# Altium schematic sheet IDC_Tester_v1_sift_register_output.SchDoc
size 420 x 297 mm; SheetNumber: 2; SheetTotal: 10
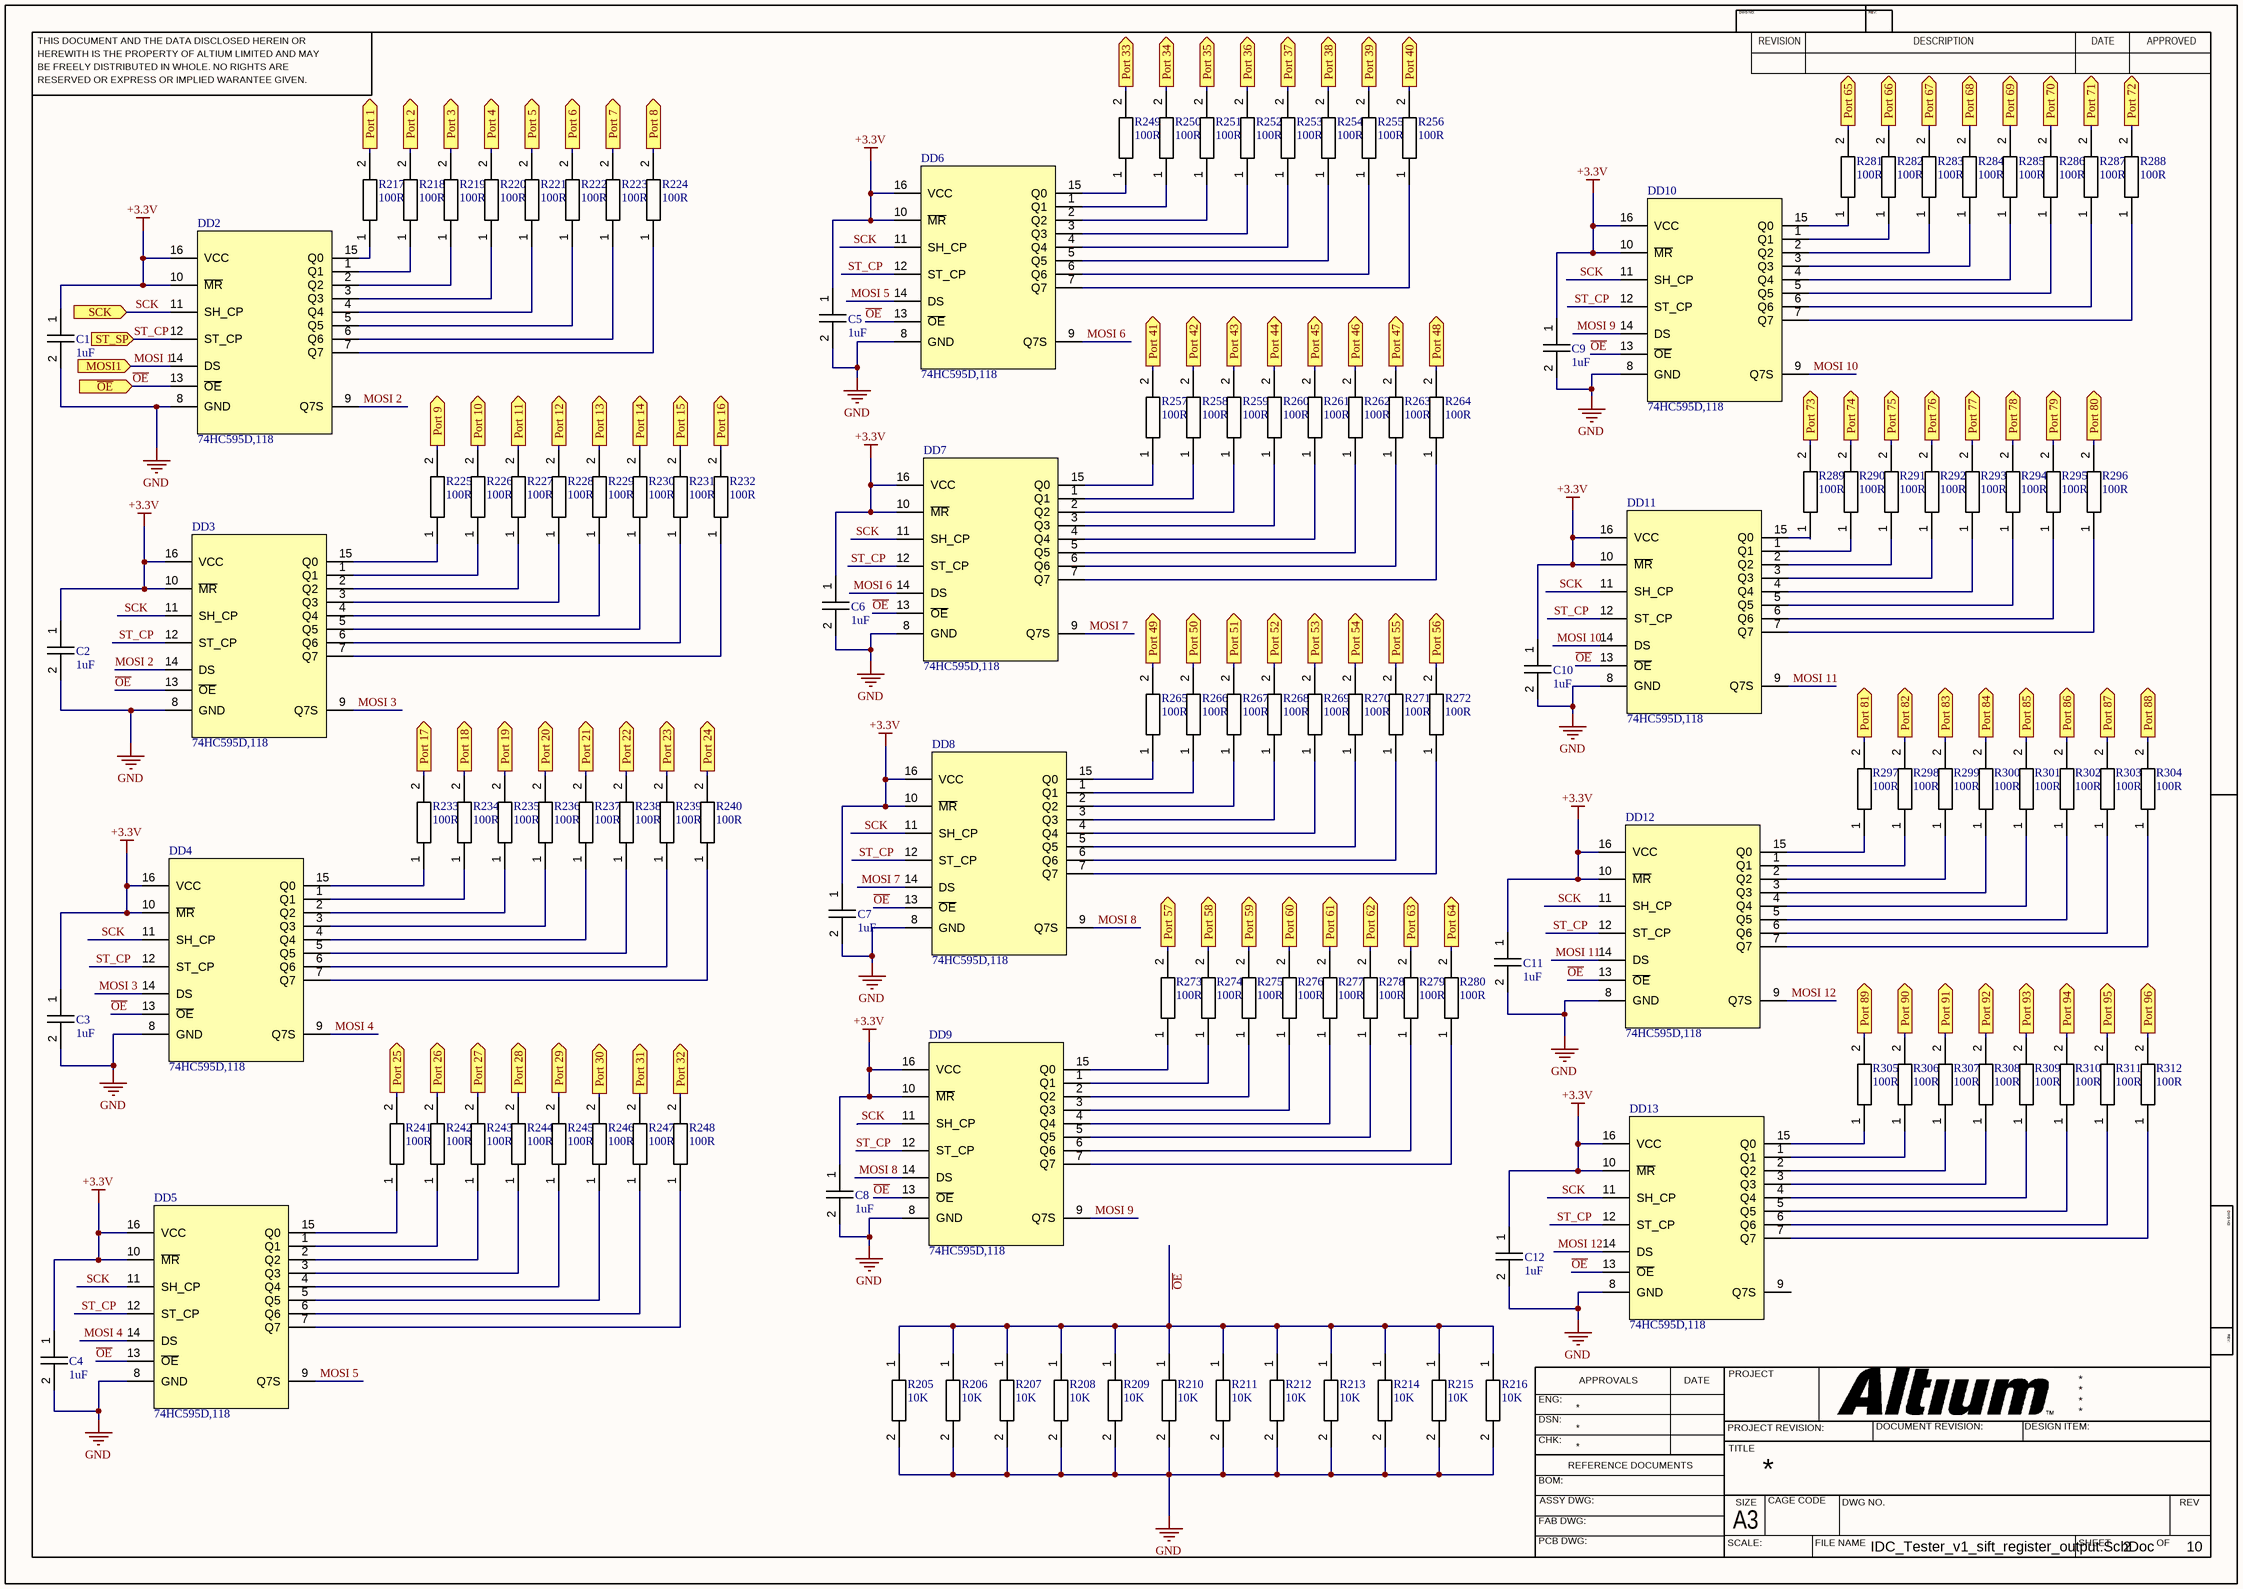
[diagram p0: IDC_Tester_v1_sift_register_output.SchDoc]

## Parts
C1  1uF  [Capacitor 0603]
C2  1uF  [Capacitor 0603]
C3  1uF  [Capacitor 0603]
C4  1uF  [Capacitor 0603]
C5  1uF  [Capacitor 0603]
C6  1uF  [Capacitor 0603]
C7  1uF  [Capacitor 0603]
C8  1uF  [Capacitor 0603]
C9  1uF  [Capacitor 0603]
C10  1uF  [Capacitor 0603]
C11  1uF  [Capacitor 0603]
C12  1uF  [Capacitor 0603]
DD2  74HC595D,118  [Shift register 74HC165 or 74HC595]
DD3  74HC595D,118  [Shift register 74HC165 or 74HC595]
DD4  74HC595D,118  [Shift register 74HC165 or 74HC595]
DD5  74HC595D,118  [Shift register 74HC165 or 74HC595]
DD6  74HC595D,118  [Shift register 74HC165 or 74HC595]
DD7  74HC595D,118  [Shift register 74HC165 or 74HC595]
DD8  74HC595D,118  [Shift register 74HC165 or 74HC595]
DD9  74HC595D,118  [Shift register 74HC165 or 74HC595]
DD10  74HC595D,118  [Shift register 74HC165 or 74HC595]
DD11  74HC595D,118  [Shift register 74HC165 or 74HC595]
DD12  74HC595D,118  [Shift register 74HC165 or 74HC595]
DD13  74HC595D,118  [Shift register 74HC165 or 74HC595]
R205  10K  [Resistor 0603]
R206  10K  [Resistor 0603]
R207  10K  [Resistor 0603]
R208  10K  [Resistor 0603]
R209  10K  [Resistor 0603]
R210  10K  [Resistor 0603]
R211  10K  [Resistor 0603]
R212  10K  [Resistor 0603]
R213  10K  [Resistor 0603]
R214  10K  [Resistor 0603]
R215  10K  [Resistor 0603]
R216  10K  [Resistor 0603]
R217  100R  [Resistor 0603]
R218  100R  [Resistor 0603]
R219  100R  [Resistor 0603]
R220  100R  [Resistor 0603]
R221  100R  [Resistor 0603]
R222  100R  [Resistor 0603]
R223  100R  [Resistor 0603]
R224  100R  [Resistor 0603]
R225  100R  [Resistor 0603]
R226  100R  [Resistor 0603]
R227  100R  [Resistor 0603]
R228  100R  [Resistor 0603]
R229  100R  [Resistor 0603]
R230  100R  [Resistor 0603]
R231  100R  [Resistor 0603]
R232  100R  [Resistor 0603]
R233  100R  [Resistor 0603]
R234  100R  [Resistor 0603]
R235  100R  [Resistor 0603]
R236  100R  [Resistor 0603]
R237  100R  [Resistor 0603]
R238  100R  [Resistor 0603]
R239  100R  [Resistor 0603]
R240  100R  [Resistor 0603]
R241  100R  [Resistor 0603]
R242  100R  [Resistor 0603]
R243  100R  [Resistor 0603]
R244  100R  [Resistor 0603]
R245  100R  [Resistor 0603]
R246  100R  [Resistor 0603]
R247  100R  [Resistor 0603]
R248  100R  [Resistor 0603]
R249  100R  [Resistor 0603]
R250  100R  [Resistor 0603]
R251  100R  [Resistor 0603]
R252  100R  [Resistor 0603]
R253  100R  [Resistor 0603]
R254  100R  [Resistor 0603]
R255  100R  [Resistor 0603]
R256  100R  [Resistor 0603]
R257  100R  [Resistor 0603]
R258  100R  [Resistor 0603]
R259  100R  [Resistor 0603]
R260  100R  [Resistor 0603]
R261  100R  [Resistor 0603]
R262  100R  [Resistor 0603]
R263  100R  [Resistor 0603]
R264  100R  [Resistor 0603]
R265  100R  [Resistor 0603]
R266  100R  [Resistor 0603]
R267  100R  [Resistor 0603]
R268  100R  [Resistor 0603]
R269  100R  [Resistor 0603]
R270  100R  [Resistor 0603]
R271  100R  [Resistor 0603]
R272  100R  [Resistor 0603]
R273  100R  [Resistor 0603]
R274  100R  [Resistor 0603]
R275  100R  [Resistor 0603]
R276  100R  [Resistor 0603]
R277  100R  [Resistor 0603]
R278  100R  [Resistor 0603]
R279  100R  [Resistor 0603]
R280  100R  [Resistor 0603]
R281  100R  [Resistor 0603]
R282  100R  [Resistor 0603]
R283  100R  [Resistor 0603]
R284  100R  [Resistor 0603]
R285  100R  [Resistor 0603]
R286  100R  [Resistor 0603]
R287  100R  [Resistor 0603]
R288  100R  [Resistor 0603]
R289  100R  [Resistor 0603]
R290  100R  [Resistor 0603]
R291  100R  [Resistor 0603]
R292  100R  [Resistor 0603]
R293  100R  [Resistor 0603]
R294  100R  [Resistor 0603]
R295  100R  [Resistor 0603]
R296  100R  [Resistor 0603]
R297  100R  [Resistor 0603]
R298  100R  [Resistor 0603]
R299  100R  [Resistor 0603]
R300  100R  [Resistor 0603]
R301  100R  [Resistor 0603]
R302  100R  [Resistor 0603]
R303  100R  [Resistor 0603]
R304  100R  [Resistor 0603]
R305  100R  [Resistor 0603]
R306  100R  [Resistor 0603]
R307  100R  [Resistor 0603]
R308  100R  [Resistor 0603]
R309  100R  [Resistor 0603]
R310  100R  [Resistor 0603]
R311  100R  [Resistor 0603]
R312  100R  [Resistor 0603]

## Ports
MOSI1 (in), Port 1 (out), Port 2 (out), Port 3 (out), Port 4 (out), Port 5 (out), Port 6 (out), Port 7 (out), Port 8 (out), Port 9 (out), Port 10 (out), Port 11 (out), Port 12 (out), Port 13 (out), Port 14 (out), Port 15 (out), Port 16 (out), Port 17 (out), Port 18 (out), Port 19 (out), Port 20 (out), Port 21 (out), Port 22 (out), Port 23 (out), Port 24 (out), Port 25 (out), Port 26 (out), Port 27 (out), Port 28 (out), Port 29 (out), Port 30 (out), Port 31 (out), Port 32 (out), Port 33 (out), Port 34 (out), Port 35 (out), Port 36 (out), Port 37 (out), Port 38 (out), Port 39 (out), Port 40 (out), Port 41 (out), Port 42 (out), Port 43 (out), Port 44 (out), Port 45 (out), Port 46 (out), Port 47 (out), Port 48 (out), Port 49 (out), Port 50 (out), Port 51 (out), Port 52 (out), Port 53 (out), Port 54 (out), Port 55 (out), Port 56 (out), Port 57 (out), Port 58 (out), Port 59 (out), Port 60 (out), Port 61 (out), Port 62 (out), Port 63 (out), Port 64 (out), Port 65 (out), Port 66 (out), Port 67 (out), Port 68 (out), Port 69 (out), Port 70 (out), Port 71 (out), Port 72 (out), Port 73 (out), Port 74 (out), Port 75 (out), Port 76 (out), Port 77 (out), Port 78 (out), Port 79 (out), Port 80 (out), Port 81 (out), Port 82 (out), Port 83 (out), Port 84 (out), Port 85 (out), Port 86 (out), Port 87 (out), Port 88 (out), Port 89 (out), Port 90 (out), Port 91 (out), Port 92 (out), Port 93 (out), Port 94 (out), Port 95 (out), Port 96 (out), SCK (in), ST_SP (in), ~{OE} (in)

## Nets
+3.3V: C1.1 C2.1 C3.1 C4.1 C5.1 C6.1 C7.1 C8.1 C9.1 C10.1 C11.1 C12.1 DD2.10(~{MR}) DD2.16(VCC) DD3.10(~{MR}) DD3.16(VCC) DD4.10(~{MR}) DD4.16(VCC) DD5.10(~{MR}) DD5.16(VCC) DD6.10(~{MR}) DD6.16(VCC) DD7.10(~{MR}) DD7.16(VCC) DD8.10(~{MR}) DD8.16(VCC) DD9.10(~{MR}) DD9.16(VCC) DD10.10(~{MR}) DD10.16(VCC) DD11.10(~{MR}) DD11.16(VCC) DD12.10(~{MR}) DD12.16(VCC) DD13.10(~{MR}) DD13.16(VCC)
GND: C1.2 C2.2 C3.2 C4.2 C5.2 C6.2 C7.2 C8.2 C9.2 C10.2 C11.2 C12.2 DD2.8(GND) DD3.8(GND) DD4.8(GND) DD5.8(GND) DD6.8(GND) DD7.8(GND) DD8.8(GND) DD9.8(GND) DD10.8(GND) DD11.8(GND) DD12.8(GND) DD13.8(GND) R205.2 R206.2 R207.2 R208.2 R209.2 R210.2 R211.2 R212.2 R213.2 R214.2 R215.2 R216.2
MOSI 1: DD2.14(DS) ; port MOSI1
MOSI 2: DD2.9(Q7S) DD3.14(DS)
MOSI 3: DD3.9(Q7S) DD4.14(DS)
MOSI 4: DD4.9(Q7S) DD5.14(DS)
MOSI 5: DD5.9(Q7S) DD6.14(DS)
MOSI 6: DD6.9(Q7S) DD7.14(DS)
MOSI 7: DD7.9(Q7S) DD8.14(DS)
MOSI 8: DD8.9(Q7S) DD9.14(DS)
MOSI 9: DD9.9(Q7S) DD10.14(DS)
MOSI 10: DD10.9(Q7S) DD11.14(DS)
MOSI 11: DD11.9(Q7S) DD12.14(DS)
MOSI 12: DD12.9(Q7S) DD13.14(DS)
~{OE}: DD2.13(~{OE}) DD3.13(~{OE}) DD4.13(~{OE}) DD5.13(~{OE}) DD6.13(~{OE}) DD7.13(~{OE}) DD8.13(~{OE}) DD9.13(~{OE}) DD10.13(~{OE}) DD11.13(~{OE}) DD12.13(~{OE}) DD13.13(~{OE}) R205.1 R206.1 R207.1 R208.1 R209.1 R210.1 R211.1 R212.1 R213.1 R214.1 R215.1 R216.1 ; port ~{OE}
Port 1: R217.2 ; port Port 1
Port 2: R218.2 ; port Port 2
Port 3: R219.2 ; port Port 3
Port 4: R220.2 ; port Port 4
Port 5: R221.2 ; port Port 5
Port 6: R222.2 ; port Port 6
Port 7: R223.2 ; port Port 7
Port 8: R224.2 ; port Port 8
Port 9: R225.2 ; port Port 9
Port 10: R226.2 ; port Port 10
Port 11: R227.2 ; port Port 11
Port 12: R228.2 ; port Port 12
Port 13: R229.2 ; port Port 13
Port 14: R230.2 ; port Port 14
Port 15: R231.2 ; port Port 15
Port 16: R232.2 ; port Port 16
Port 17: R233.2 ; port Port 17
Port 18: R234.2 ; port Port 18
Port 19: R235.2 ; port Port 19
Port 20: R236.2 ; port Port 20
Port 21: R237.2 ; port Port 21
Port 22: R238.2 ; port Port 22
Port 23: R239.2 ; port Port 23
Port 24: R240.2 ; port Port 24
Port 25: R241.2 ; port Port 25
Port 26: R242.2 ; port Port 26
Port 27: R243.2 ; port Port 27
Port 28: R244.2 ; port Port 28
Port 29: R245.2 ; port Port 29
Port 30: R246.2 ; port Port 30
Port 31: R247.2 ; port Port 31
Port 32: R248.2 ; port Port 32
Port 33: R249.2 ; port Port 33
Port 34: R250.2 ; port Port 34
Port 35: R251.2 ; port Port 35
Port 36: R252.2 ; port Port 36
Port 37: R253.2 ; port Port 37
Port 38: R254.2 ; port Port 38
Port 39: R255.2 ; port Port 39
Port 40: R256.2 ; port Port 40
Port 41: R257.2 ; port Port 41
Port 42: R258.2 ; port Port 42
Port 43: R259.2 ; port Port 43
Port 44: R260.2 ; port Port 44
Port 45: R261.2 ; port Port 45
Port 46: R262.2 ; port Port 46
Port 47: R263.2 ; port Port 47
Port 48: R264.2 ; port Port 48
Port 49: R265.2 ; port Port 49
Port 50: R266.2 ; port Port 50
Port 51: R267.2 ; port Port 51
Port 52: R268.2 ; port Port 52
Port 53: R269.2 ; port Port 53
Port 54: R270.2 ; port Port 54
Port 55: R271.2 ; port Port 55
Port 56: R272.2 ; port Port 56
Port 57: R273.2 ; port Port 57
Port 58: R274.2 ; port Port 58
Port 59: R275.2 ; port Port 59
Port 60: R276.2 ; port Port 60
Port 61: R277.2 ; port Port 61
Port 62: R278.2 ; port Port 62
Port 63: R279.2 ; port Port 63
Port 64: R280.2 ; port Port 64
Port 65: R281.2 ; port Port 65
Port 66: R282.2 ; port Port 66
Port 67: R283.2 ; port Port 67
Port 68: R284.2 ; port Port 68
Port 69: R285.2 ; port Port 69
Port 70: R286.2 ; port Port 70
Port 71: R287.2 ; port Port 71
Port 72: R288.2 ; port Port 72
Port 73: R289.2 ; port Port 73
Port 74: R290.2 ; port Port 74
Port 75: R291.2 ; port Port 75
Port 76: R292.2 ; port Port 76
Port 77: R293.2 ; port Port 77
Port 78: R294.2 ; port Port 78
Port 79: R295.2 ; port Port 79
Port 80: R296.2 ; port Port 80
Port 81: R297.2 ; port Port 81
Port 82: R298.2 ; port Port 82
Port 83: R299.2 ; port Port 83
Port 84: R300.2 ; port Port 84
Port 85: R301.2 ; port Port 85
Port 86: R302.2 ; port Port 86
Port 87: R303.2 ; port Port 87
Port 88: R304.2 ; port Port 88
Port 89: R305.2 ; port Port 89
Port 90: R306.2 ; port Port 90
Port 91: R307.2 ; port Port 91
Port 92: R308.2 ; port Port 92
Port 93: R309.2 ; port Port 93
Port 94: R310.2 ; port Port 94
Port 95: R311.2 ; port Port 95
Port 96: R312.2 ; port Port 96
SCK: DD2.11(SH_CP) DD3.11(SH_CP) DD4.11(SH_CP) DD5.11(SH_CP) DD6.11(SH_CP) DD7.11(SH_CP) DD8.11(SH_CP) DD9.11(SH_CP) DD10.11(SH_CP) DD11.11(SH_CP) DD12.11(SH_CP) DD13.11(SH_CP) ; port SCK
ST_CP: DD2.12(ST_CP) DD3.12(ST_CP) DD4.12(ST_CP) DD5.12(ST_CP) DD6.12(ST_CP) DD7.12(ST_CP) DD8.12(ST_CP) DD9.12(ST_CP) DD10.12(ST_CP) DD11.12(ST_CP) DD12.12(ST_CP) DD13.12(ST_CP) ; port ST_SP
NetDD2_1: DD2.1(Q1) R218.1
NetDD2_2: DD2.2(Q2) R219.1
NetDD2_3: DD2.3(Q3) R220.1
NetDD2_4: DD2.4(Q4) R221.1
NetDD2_5: DD2.5(Q5) R222.1
NetDD2_6: DD2.6(Q6) R223.1
NetDD2_7: DD2.7(Q7) R224.1
NetDD2_15: DD2.15(Q0) R217.1
NetDD3_1: DD3.1(Q1) R226.1
NetDD3_2: DD3.2(Q2) R227.1
NetDD3_3: DD3.3(Q3) R228.1
NetDD3_4: DD3.4(Q4) R229.1
NetDD3_5: DD3.5(Q5) R230.1
NetDD3_6: DD3.6(Q6) R231.1
NetDD3_7: DD3.7(Q7) R232.1
NetDD3_15: DD3.15(Q0) R225.1
NetDD4_1: DD4.1(Q1) R234.1
NetDD4_2: DD4.2(Q2) R235.1
NetDD4_3: DD4.3(Q3) R236.1
NetDD4_4: DD4.4(Q4) R237.1
NetDD4_5: DD4.5(Q5) R238.1
NetDD4_6: DD4.6(Q6) R239.1
NetDD4_7: DD4.7(Q7) R240.1
NetDD4_15: DD4.15(Q0) R233.1
NetDD5_1: DD5.1(Q1) R242.1
NetDD5_2: DD5.2(Q2) R243.1
NetDD5_3: DD5.3(Q3) R244.1
NetDD5_4: DD5.4(Q4) R245.1
NetDD5_5: DD5.5(Q5) R246.1
NetDD5_6: DD5.6(Q6) R247.1
NetDD5_7: DD5.7(Q7) R248.1
NetDD5_15: DD5.15(Q0) R241.1
NetDD6_1: DD6.1(Q1) R250.1
NetDD6_2: DD6.2(Q2) R251.1
NetDD6_3: DD6.3(Q3) R252.1
NetDD6_4: DD6.4(Q4) R253.1
NetDD6_5: DD6.5(Q5) R254.1
NetDD6_6: DD6.6(Q6) R255.1
NetDD6_7: DD6.7(Q7) R256.1
NetDD6_15: DD6.15(Q0) R249.1
NetDD7_1: DD7.1(Q1) R258.1
NetDD7_2: DD7.2(Q2) R259.1
NetDD7_3: DD7.3(Q3) R260.1
NetDD7_4: DD7.4(Q4) R261.1
NetDD7_5: DD7.5(Q5) R262.1
NetDD7_6: DD7.6(Q6) R263.1
NetDD7_7: DD7.7(Q7) R264.1
NetDD7_15: DD7.15(Q0) R257.1
NetDD8_1: DD8.1(Q1) R266.1
NetDD8_2: DD8.2(Q2) R267.1
NetDD8_3: DD8.3(Q3) R268.1
NetDD8_4: DD8.4(Q4) R269.1
NetDD8_5: DD8.5(Q5) R270.1
NetDD8_6: DD8.6(Q6) R271.1
NetDD8_7: DD8.7(Q7) R272.1
NetDD8_15: DD8.15(Q0) R265.1
NetDD9_1: DD9.1(Q1) R274.1
NetDD9_2: DD9.2(Q2) R275.1
NetDD9_3: DD9.3(Q3) R276.1
NetDD9_4: DD9.4(Q4) R277.1
NetDD9_5: DD9.5(Q5) R278.1
NetDD9_6: DD9.6(Q6) R279.1
NetDD9_7: DD9.7(Q7) R280.1
NetDD9_15: DD9.15(Q0) R273.1
NetDD10_1: DD10.1(Q1) R282.1
NetDD10_2: DD10.2(Q2) R283.1
NetDD10_3: DD10.3(Q3) R284.1
NetDD10_4: DD10.4(Q4) R285.1
NetDD10_5: DD10.5(Q5) R286.1
NetDD10_6: DD10.6(Q6) R287.1
NetDD10_7: DD10.7(Q7) R288.1
NetDD10_15: DD10.15(Q0) R281.1
NetDD11_1: DD11.1(Q1) R290.1
NetDD11_2: DD11.2(Q2) R291.1
NetDD11_3: DD11.3(Q3) R292.1
NetDD11_4: DD11.4(Q4) R293.1
NetDD11_5: DD11.5(Q5) R294.1
NetDD11_6: DD11.6(Q6) R295.1
NetDD11_7: DD11.7(Q7) R296.1
NetDD11_15: DD11.15(Q0) R289.1
NetDD12_1: DD12.1(Q1) R298.1
NetDD12_2: DD12.2(Q2) R299.1
NetDD12_3: DD12.3(Q3) R300.1
NetDD12_4: DD12.4(Q4) R301.1
NetDD12_5: DD12.5(Q5) R302.1
NetDD12_6: DD12.6(Q6) R303.1
NetDD12_7: DD12.7(Q7) R304.1
NetDD12_15: DD12.15(Q0) R297.1
NetDD13_1: DD13.1(Q1) R306.1
NetDD13_2: DD13.2(Q2) R307.1
NetDD13_3: DD13.3(Q3) R308.1
NetDD13_4: DD13.4(Q4) R309.1
NetDD13_5: DD13.5(Q5) R310.1
NetDD13_6: DD13.6(Q6) R311.1
NetDD13_7: DD13.7(Q7) R312.1
NetDD13_15: DD13.15(Q0) R305.1

Not connected (* = marked no-connect by the designer): DD13 9(Q7S)

## Notes on the sheet
- THIS DOCUMENT AND THE DATA DISCLOSED HEREIN OR
- HEREWITH IS THE PROPERTY OF ALTIUM LIMITED AND MAY
- DWG NO:
- REVISION
- REV:
- DESCRIPTION
- DATE
- APPROVED
- BE FREELY DISTRIBUTED IN WHOLE. NO RIGHTS ARE
- RESERVED OR EXPRESS OR IMPLIED WARANTEE GIVEN.
- ENG:
- APPROVALS
- PROJECT
- DSN:
- CHK:
- REFERENCE DOCUMENTS
- PROJECT REVISION:
- TITLE
- DOCUMENT REVISION:
- DESIGN ITEM:
- BOM:
- FAB DWG:
- PCB DWG:
- ASSY DWG:
- SCALE:
- A3
- SIZE
- CAGE CODE
- FILE NAME
- DWG NO.
- SHEET
- OF
- REV

## Library data of the parts
C1-C12 = Capacitor: Part Number: SMD CAP CER 1UF 25V X5R 0603 (CC0603KRX5R8BB105); Added by: viskov2055@gmail.com; Mount_Type: SMD; Solder_Amount: 2; Pkg: 0603; Created at: 16/02/2024; Mount: MOUNT
DD2-DD13 = 74HC595D,118: 74HC Series 6 V 3-State Surface Mount Shift Register - SOIC-16; Manufacturer: Nexperia; Added by: viskov2055@gmail.com; Mount_Type: SMD; Solder_Amount: 16; Supplier 1: Rs; Manufacturer Part Number: 74HC595D,118; RoHS: Yes; Category: Shift Registers; Stock 1: 7500; Pricing 1: 2500=32,44, 5000=31,895 (RUB); ComponentLink1URL: http://www.farnell.com/datasheets/2038613.pdf?src-supplier=Farnell; ComponentLink1Description: http://www.farnell.com/datasheets/2038613.pdf?src-supplier=Farnell; ComponentLink2URL: https://assets.nexperia.com/documents/data-sheet/74HC_HCT595.pdf?src-supplier=Digikey; ComponentLink2Description: https://assets.nexperia.com/documents/data-sheet/74HC_HCT595.pdf?src-supplier=Digikey; ComponentLink3URL: https://datasheet.octopart.com/74HC595D%2C118-Nexperia-datasheet-62292421.pdf?src-supplier=Newark; ComponentLink3Description: https://datasheet.octopart.com/74HC595D%2C118-Nexperia-datasheet-62292421.pdf?src-supplier=Newark; ComponentLink4URL: http://www.farnell.com/datasheets/2038613.pdf?src-supplier=Newark; ComponentLink4Description: http://www.farnell.com/datasheets/2038613.pdf?src-supplier=Newark; ComponentLink5URL: http://www.farnell.com/datasheets/2038613.pdf?src-supplier=Element14; ComponentLink5Description: http://www.farnell.com/datasheets/2038613.pdf?src-supplier=Element14; ComponentLink6URL: https://datasheet.octopart.com/74HC595D%2C118-Nexperia-datasheet-11979826.pdf?src-supplier=Element14; ComponentLink6Description: https://datasheet.octopart.com/74HC595D%2C118-Nexperia-datasheet-11979826.pdf?src-supplier=Element14; Supplier Part Number 1: 1707956; Created at: 13/02/2024; Mount: MOUNT; Pkg: SOIC-16; Part Number: 74HC595D,118
R205-R216 = Resistor 10K: Part Number: SMD RES 10K OHM 1%±100ppm/°C 0603 (RMCF0603FT10K0); Added by: viskov2055@gmail.com; Mount_Type: SMD; Solder_Amount: 2; Pkg: 0603; Created at: 15/02/2024; Mount: MOUNT
R217-R312 = Resistor 100R: Part Number: SMD RES 100 OHM 1% ±100ppm/°C 0603 (RMCF0603FT100R); Added by: viskov2055@gmail.com; Mount_Type: SMD; Solder_Amount: 2; Pkg: 0603; Created at: 19/02/2024; Mount: MOUNT